# Altium schematic sheet MCU Core.SchDoc
size A; SheetNumber: 1; SheetTotal: 3
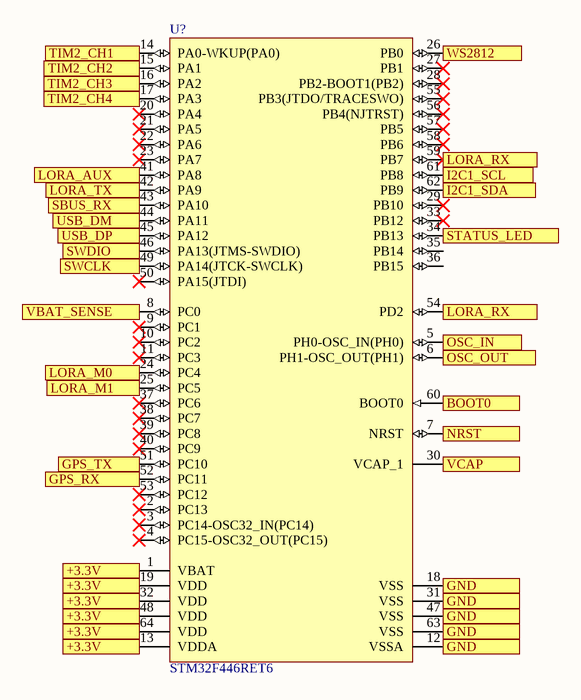
[diagram p0: MCU Core.SchDoc]

## Parts
U?  STM32F446RET6  [STM-LQFP64_L]

## Ports
+3.3V, BOOT0, GND, GPS_RX, GPS_TX, I2C1_SCL, I2C1_SDA, LORA_AUX, LORA_M0, LORA_M1, LORA_RX, LORA_TX, NRST, OSC_IN, OSC_OUT, SBUS_RX, STATUS_LED, SWCLK, SWDIO, TIM2_CH1, TIM2_CH2, TIM2_CH3, TIM2_CH4, USB_DM, USB_DP, VBAT_SENSE, VCAP, WS2812

## Nets
+3.3V: U?.1(VBAT) U?.13(VDDA) U?.19(VDD) U?.32(VDD) U?.48(VDD) U?.64(VDD) ; port +3.3V
BOOT0: U?.60(BOOT0) ; port BOOT0
GND: U?.12(VSSA) U?.18(VSS) U?.31(VSS) U?.47(VSS) U?.63(VSS) ; port GND
GPS_RX: U?.52(PC11) ; port GPS_RX
GPS_TX: U?.51(PC10) ; port GPS_TX
I2C1_SCL: U?.61(PB8) ; port I2C1_SCL
I2C1_SDA: U?.62(PB9) ; port I2C1_SDA
LORA_AUX: U?.41(PA8) ; port LORA_AUX
LORA_M0: U?.24(PC4) ; port LORA_M0
LORA_M1: U?.25(PC5) ; port LORA_M1
LORA_RX: U?.54(PD2) U?.59(PB7) ; port LORA_RX
LORA_TX: U?.42(PA9) ; port LORA_TX
NRST: U?.7(NRST) ; port NRST
OSC_IN: U?.5(PH0-OSC_IN(PH0)) ; port OSC_IN
OSC_OUT: U?.6(PH1-OSC_OUT(PH1)) ; port OSC_OUT
SBUS_RX: U?.43(PA10) ; port SBUS_RX
STATUS_LED: U?.34(PB13) ; port STATUS_LED
SWCLK: U?.49(PA14(JTCK-SWCLK)) ; port SWCLK
SWDIO: U?.46(PA13(JTMS-SWDIO)) ; port SWDIO
TIM2_CH1: U?.14(PA0-WKUP(PA0)) ; port TIM2_CH1
TIM2_CH2: U?.15(PA1) ; port TIM2_CH2
TIM2_CH3: U?.16(PA2) ; port TIM2_CH3
TIM2_CH4: U?.17(PA3) ; port TIM2_CH4
USB_DM: U?.44(PA11) ; port USB_DM
USB_DP: U?.45(PA12) ; port USB_DP
VBAT_SENSE: U?.8(PC0) ; port VBAT_SENSE
VCAP: U?.30(VCAP_1) ; port VCAP
WS2812: U?.26(PB0) ; port WS2812

Not connected (* = marked no-connect by the designer): U? 2(PC13)* 3(PC14-OSC32_IN(PC14))* 4(PC15-OSC32_OUT(PC15))* 9(PC1)* 10(PC2)* 11(PC3)* 20(PA4)* 21(PA5)* 22(PA6)* 23(PA7)* 27(PB1)* 28(PB2-BOOT1(PB2))* 29(PB10)* 33(PB12)* 35(PB14) 36(PB15) 37(PC6)* 38(PC7)* 39(PC8)* 40(PC9)* 50(PA15(JTDI))* 53(PC12)* 55(PB3(JTDO/TRACESWO))* 56(PB4(NJTRST))* 57(PB5)* 58(PB6)*

## Library data of the parts
U? = CMP-0243-00218-1: ARM Cortex-M4 32-bit MCU+FPU, 512 KB Flash, 128 KB Internal RAM, 50 I/Os, 64-Pin LQFP, -40 to 85 degC, Tray; I/Os (High Current): 50; Supply Voltage(Vcc) min (V): 1.7; Operating Frequency(F) (Processor speed) (MHz): 180; D/A Converter: 2; Internal RAM Size (kB): 128; FLASH Size (Prog) (kB): 512; Core: ARM Cortex-M4; ComponentLink1Description: Manufacturer URL; Package Reference: 64-Pin Low-profile Quad Flat Package, Body 10 x 10 mm, Pitch 0.5 mm; ComponentLink2URL: http://www.st.com/st-web-ui/static/active/en/resource/technical/document/datasheet/DM00141306.pdf; Packing: Tray; DatasheetVersion: Rev. 6; ComponentLink1URL: http://www.st.com/; ComponentLink2Description: Datasheet; Package Description: LQFP64; Mounting Technology: Surface Mount